# Altium schematic sheet Sheet2 (1).SchDoc
size A3; SheetNumber: 1; SheetTotal: 1
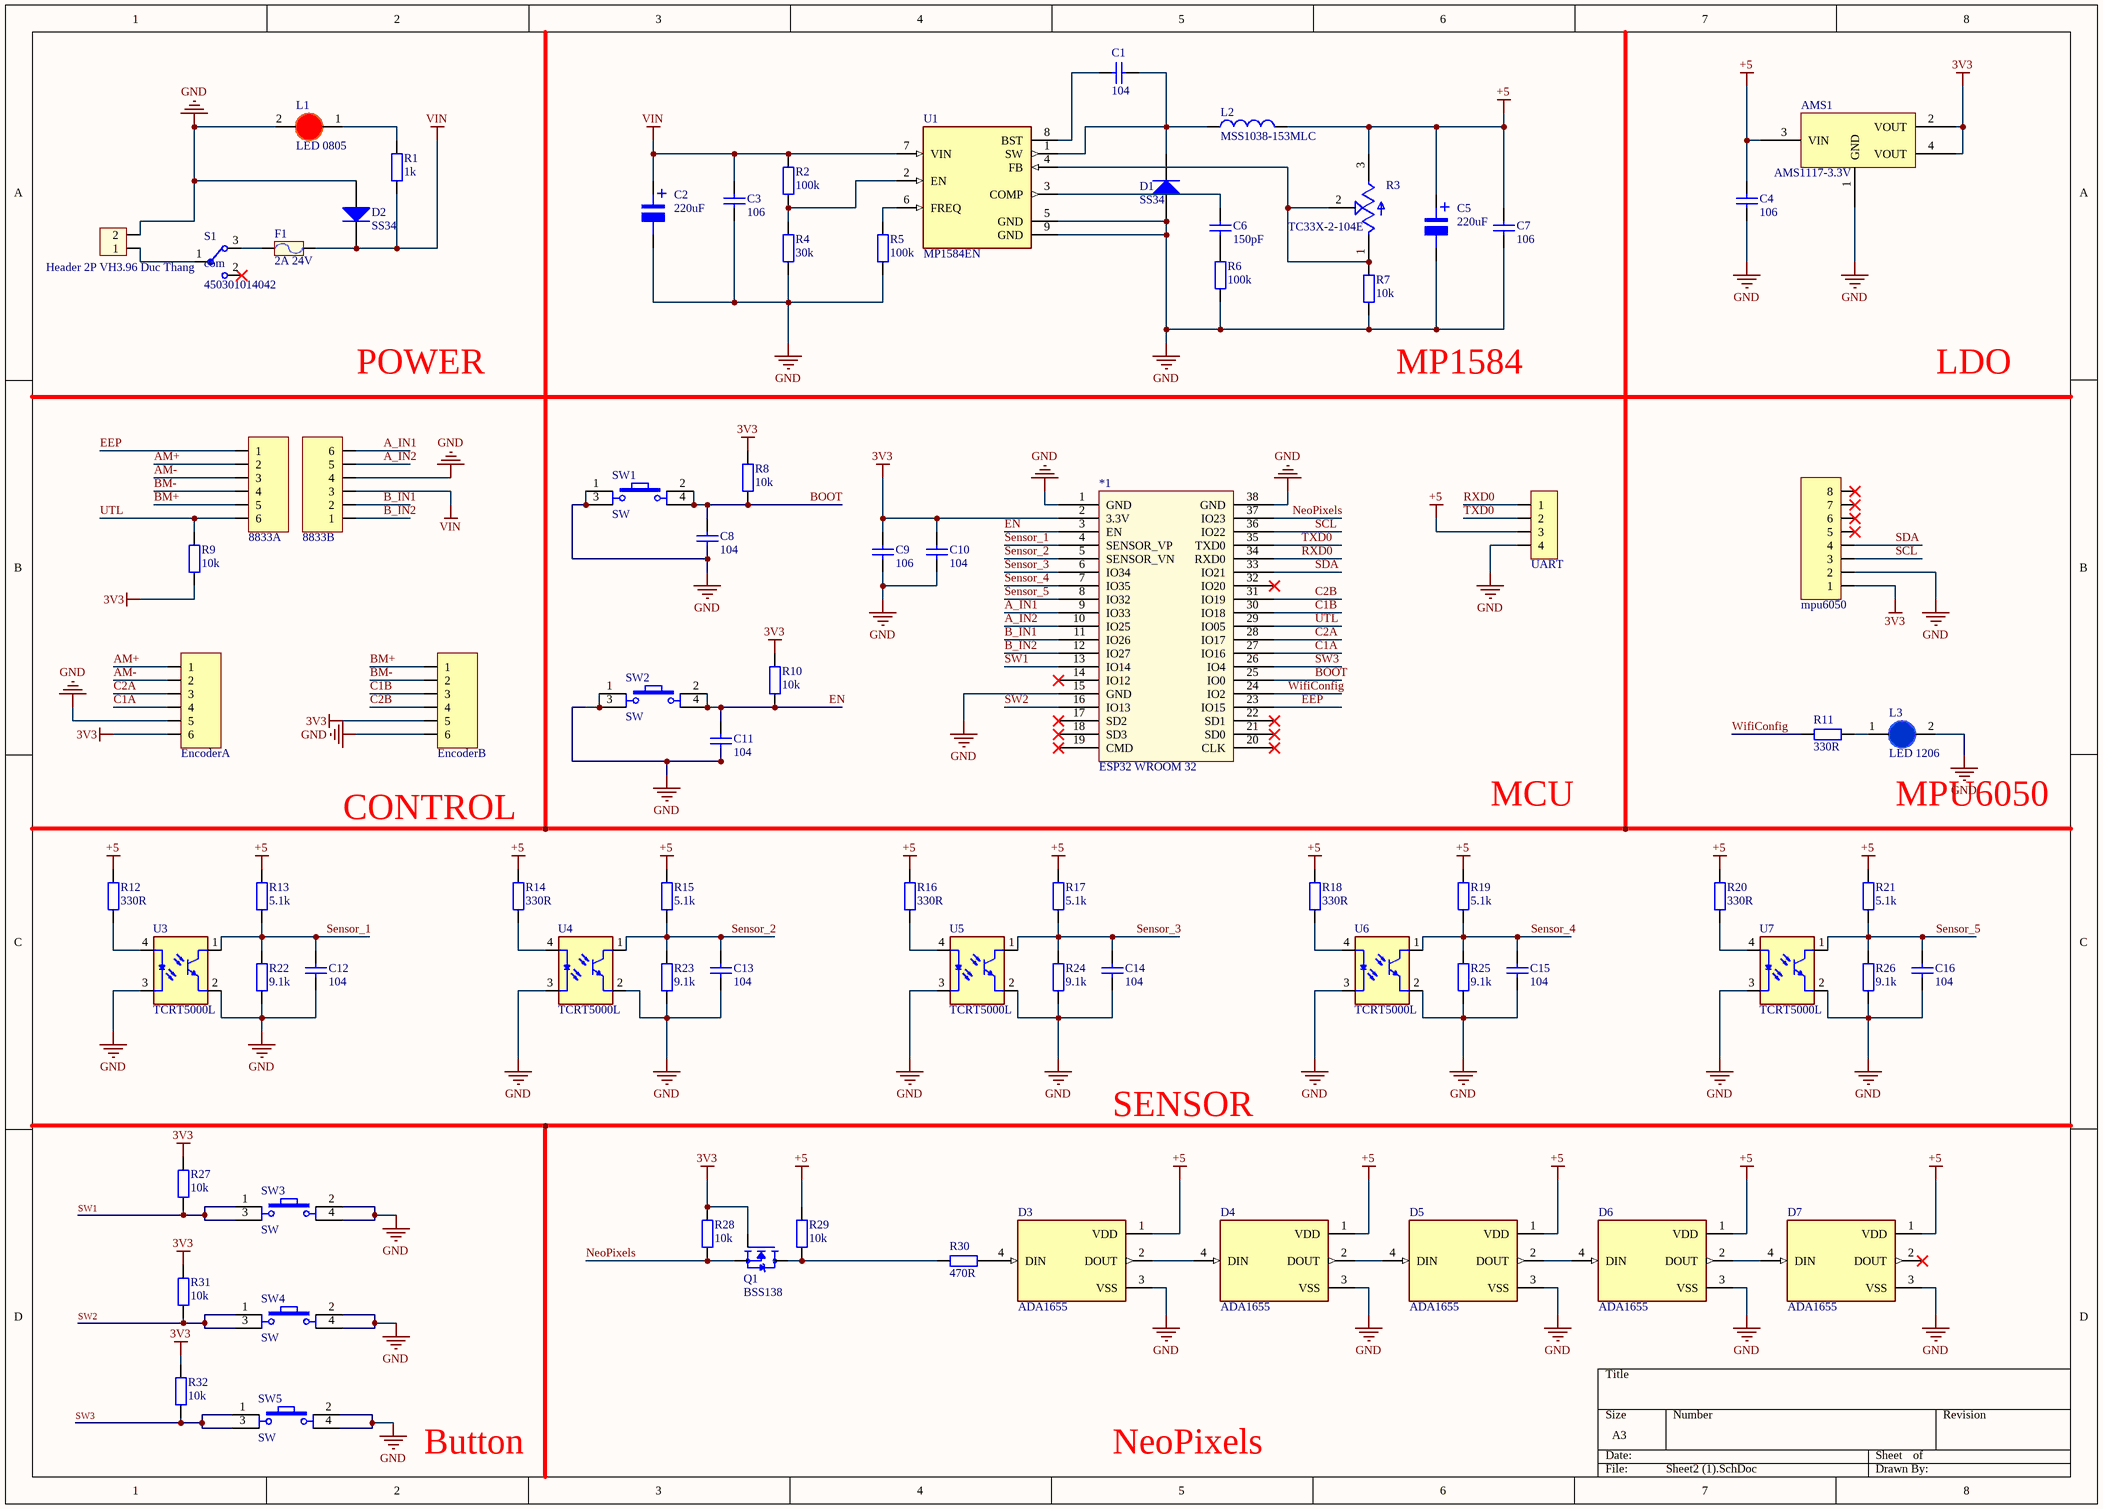
[diagram p0: Sheet2 (1).SchDoc]

## Parts
*1  ESP32 WROOM 32  [ESP32-WROOM-32D]
AMS1  AMS1117-3.3V  [SOT223]
C1  104  [tu 0603]
C2  220uF  [tu nhom 8 (f)]
C3  106  [tu 0603]
C4  106  [tu 0603]
C5  220uF  [tu nhom 8 (f)]
C6  150pF  [Cap 0603]
C7  106  [tu 0603]
C8  104  [tu 0603]
C9  106  [tu 0603]
C10  104  [tu 0603]
C11  104  [tu 0603]
C12  104  [tu 0603]
C13  104  [tu 0603]
C14  104  [tu 0603]
C15  104  [tu 0603]
C16  104  [tu 0603]
D1  SS34  [DIODE SMA]
D2  SS34  [DIODE SMA]
D3  ADA1655  [LED_ADA1655]
D4  ADA1655  [LED_ADA1655]
D5  ADA1655  [LED_ADA1655]
D6  ADA1655  [LED_ADA1655]
D7  ADA1655  [LED_ADA1655]
F1  2A 24V  [Cau chi tu phuc hoi 2A 24V SMD1812]
H?  Header 2P VH3.96 Duc Thang  [VH3.96M-2]
JP1  8833A  [JP 1x6 DT]
JP2  8833B  [JP 1x6 DT]
JP3  UART  [JP 1x4 DT]
JP4  EncoderA  [JP 1x6 DT]
JP5  EncoderB  [JP 1x6 DT]
JP?  mpu6050  [JP 1x8 DT]
L1  LED 0805  [LED-1206-Red]
L2  MSS1038-153MLC  [IND_370_401_140X70_SMD]
L3  LED 1206  [LED-1206-Blue]
Q1  BSS138  [SOT95P240X111-3N]
R1  1k  [tro smd 0805]
R2  100k  [tro smd 0603]
R3  TC33X-2-104E  [TRIM_TC33X-2-502G]
R4  30k  [RES 0603]
R5  100k  [tro smd 0603]
R6  100k  [tro smd 0603]
R7  10k  [tro smd 0603]
R8  10k  [tro smd 0603]
R9  10k  [tro smd 0603]
R10  10k  [tro smd 0603]
R11  330R  [Tro SMD 0805]
R12  330R  [tro smd 0603]
R13  5.1k  [RES 0603]
R14  330R  [tro smd 0603]
R15  5.1k  [RES 0603]
R16  330R  [tro smd 0603]
R17  5.1k  [RES 0603]
R18  330R  [tro smd 0603]
R19  5.1k  [RES 0603]
R20  330R  [tro smd 0603]
R21  5.1k  [RES 0603]
R22  9.1k  [RES 0603]
R23  9.1k  [RES 0603]
R24  9.1k  [RES 0603]
R25  9.1k  [RES 0603]
R26  9.1k  [RES 0603]
R27  10k  [tro smd 0603]
R28  10k  [tro smd 0603]
R29  10k  [tro smd 0603]
R30  470R  [RES 0603]
R31  10k  [tro smd 0603]
R32  10k  [tro smd 0603]
S1  450301014042  [450301014042]
SW1  SW  [SW4 - SMD]
SW2  SW  [SW4 - SMD]
SW3  SW  [SW4 - SMD]
SW4  SW  [SW4 - SMD]
SW5  SW  [SW4 - SMD]
U1  MP1584EN  [SOIC127P600X170-9N]
U3  TCRT5000L  [XDCR_TCRT5000L]
U4  TCRT5000L  [XDCR_TCRT5000L]
U5  TCRT5000L  [XDCR_TCRT5000L]
U6  TCRT5000L  [XDCR_TCRT5000L]
U7  TCRT5000L  [XDCR_TCRT5000L]

## Nets
3V3: *1.2(3.3V) AMS1.2(VOUT) AMS1.4(VOUT) C9.1 C10.1 JP4.6 JP5.5 JP?.1 Q1.1(G) R8.2 R9.1 R10.2 R27.2 R28.2 R31.2 R32.2
+5: AMS1.3(VIN) C4.1 C5.1 C7.1 D3.1(VDD) D4.1(VDD) D5.1(VDD) D6.1(VDD) D7.1(VDD) JP3.3 L2.2 R3.3(CW) R12.2 R13.2 R14.2 R15.2 R16.2 R17.2 R18.2 R19.2 R20.2 R21.2 R29.2
GND: *1.1(GND) *1.15(GND) *1.38(GND) AMS1.1(GND) C2.2 C3.2 C4.2 C5.2 C7.2 C8.2 C9.2 C10.2 C11.2 C12.2 C13.2 C14.2 C15.2 C16.2 D1.1(A) D2.1(A) D3.3(VSS) D4.3(VSS) D5.3(VSS) D6.3(VSS) D7.3(VSS) H?.2 JP2.4 JP3.4 JP4.5 JP5.6 JP?.2 L1.2(K) L3.2(K) R4.1 R5.2 R6.2 R7.1 R22.1 R23.1 R24.1 R25.1 R26.1 SW1.1 SW1.3 SW2.1 SW2.3 SW3.2 SW3.4 SW4.2 SW4.4 SW5.2 SW5.4 U1.5(GND) U1.9(GND) U3.2(E) U3.3(C) U4.2(E) U4.3(C) U5.2(E) U5.3(C) U6.2(E) U6.3(C) U7.2(E) U7.3(C)
VIN: C2.1 C3.1 D2.2(K) F1.2 JP2.3 R1.1 R2.1 U1.7(VIN)
A_IN1: *1.9(IO33) JP2.6
A_IN2: *1.10(IO25) JP2.5
AM+: JP1.2 JP4.1
AM-: JP1.3 JP4.2
B_IN1: *1.11(IO26) JP2.2
B_IN2: *1.12(IO27) JP2.1
BM+: JP1.5 JP5.1
BM-: JP1.4 JP5.2
BOOT: *1.25(IO0) C8.1 R8.1 SW1.2 SW1.4
C1A: *1.27(IO16) JP4.4
C1B: *1.30(IO18) JP5.3
C2A: *1.28(IO17) JP4.3
C2B: *1.31(IO19) JP5.4
EEP: *1.23(IO15) JP1.1
EN: *1.3(EN) C11.1 R10.1 SW2.2 SW2.4
NeoPixels: *1.37(IO23) Q1.2(S) R28.1
RXD0: *1.34(RXD0) JP3.1
SCL: *1.36(IO22) JP?.3
SDA: *1.33(IO21) JP?.4
Sensor_1: *1.4(SENSOR_VP) C12.1 R13.1 R22.2 U3.1(CO)
Sensor_2: *1.5(SENSOR_VN) C13.1 R15.1 R23.2 U4.1(CO)
Sensor_3: *1.6(IO34) C14.1 R17.1 R24.2 U5.1(CO)
Sensor_4: *1.7(IO35) C15.1 R19.1 R25.2 U6.1(CO)
Sensor_5: *1.8(IO32) C16.1 R21.1 R26.2 U7.1(CO)
SW1: *1.13(IO14) R27.1 SW3.1 SW3.3
SW2: *1.16(IO13) R31.1 SW4.1 SW4.3
SW3: *1.26(IO4) R32.1 SW5.1 SW5.3
TXD0: *1.35(TXD0) JP3.2
UTL: *1.29(IO05) JP1.6 R9.2
WifiConfig: *1.24(IO2) R11.1
NetC1_1: C1.1 U1.8(BST)
NetC1_2: C1.2 D1.2(K) L2.1 U1.1(SW)
NetC6_1: C6.1 U1.3(COMP)
NetC6_2: C6.2 R6.1
NetD3_2: D3.2(DOUT) D4.4(DIN)
NetD3_4: D3.4(DIN) R30.2
NetD4_2: D4.2(DOUT) D5.4(DIN)
NetD5_2: D5.2(DOUT) D6.4(DIN)
NetD6_2: D6.2(DOUT) D7.4(DIN)
NetF1_1: F1.1 S1.3
NetH?_1: H?.1 S1.1
NetL1_1: L1.1(A) R1.2
NetL3_1: L3.1(A) R11.2
NetQ1_3: Q1.3(D) R29.1 R30.1
NetR2_2: R2.2 R4.2 U1.2(EN)
NetR3_1: R3.1(CCW) R3.2(W) R7.2 U1.4(FB)
NetR5_1: R5.1 U1.6(FREQ)
NetR12_1: R12.1 U3.4(A)
NetR14_1: R14.1 U4.4(A)
NetR16_1: R16.1 U5.4(A)
NetR18_1: R18.1 U6.4(A)
NetR20_1: R20.1 U7.4(A)

Not connected (* = marked no-connect by the designer): *1 14(IO12)* 17(SD2)* 18(SD3)* 19(CMD)* 20(CLK)* 21(SD0)* 22(SD1)* 32(IO20)*; D7 2(DOUT)*; JP? 5* 6* 7* 8*; S1 2*

## Notes on the sheet
- POWER
- (near R7) MP1584
- LDO
- CONTROL
- MCU
- (near L3) MPU6050
- SENSOR
- Button
- NeoPixels
- (in symbol 450301014042) com
- (in symbol Tu Nhom 220uF 25V) +

## Library data of the parts
AMS1 = AMS1117 SMD: Dán; Value: AMS1117-3.3V SOT223; Don_Vi: Con; Ma_Hang: MH000596; Ghi_Chu: *; Kieu_Chan: *; Chung_Loai: Dán
C1 C8 C10-C16 = Tu 0603 104 50V 10%: Dán; Don_Vi: Con; So_Chan: 2; Ten_Linh_Kien: Tụ 0603 104-100nF 10% 50V; Ma_Hang: MH004568; Chung_Loai: Dán; Kieu_Chan: *
C2 C5 = Tu Nhom 220uF 25V: Dán; Don_Vi: Con; So_Chan: 2; Ten_Linh_Kien: Tụ Nhôm 220uF 25V; Ma_Hang: MH002221; Chung_Loai: Dán; Kieu_Chan: *
C3 C4 C7 C9 = Tu 0603 106 16V 20%: Dán; Don_Vi: Con; So_Chan: 2; Ten_Linh_Kien: Tụ 0603-10uF 20% 16V; Ma_Hang: MH004848; Chung_Loai: Dán; Kieu_Chan: *
C6 = Tu 0805 15pF 50V 10%: Dán; Don_Vi: Con; So_Chan: 2; Ten_Linh_Kien: Tụ 0805 15P 10% 50V; Ma_Hang: MH004556; Chung_Loai: Dán; Kieu_Chan: *
D1 D2 = Diode SS34 ( 1N5822 ): Dán; Don_Vi: Con; Ma_Hang: MH002104; Ten_Linh_Kien: Diode SS34 3A 40V SMA ( 1N5822 SS34A); Kieu_Chan: *; Chung_Loai: Dán
D3-D7 = ADA1655: WS2812B 5050 RGB LED with Integrated Driver Chip - 10 Pack; MF: Adafruit Industries; Package: 5050 Worldsemi; Check_prices: https://www.snapeda.com/parts/ADA1655/Adafruit%20Industries/view-part/48810/?ref=eda; Value: *; Price: None; MP: ADA1655; SnapEDA_Link: https://www.snapeda.com/parts/ADA1655/Adafruit%20Industries/view-part/48810/?ref=snap; Availability: No availability data
F1 = Cau chi tu phuc hoi 2A 24V SMD1812: 2A 24V SMD1812; Ma_Hang: MH010033; Ten: Cầu Chì Tự Phục Hồi 2A 24V SMD1812
H? = Header 2P VH3.96 Duc Thang: Cắm; Ten_Linh_Kien: Header 2P XH2.54-2P Đực Thẳng; Don_Vi: Con; Ma_Hang: MH001283; Chung_Loai: Cắm
JP1 JP2 JP4 JP5 = JP 1x6 2.54 Duc Thang: Cắm; Ten_Linh_Kien: Jump Đơn Đực 2.54MM 1x40P Thẳng 11MM; Don_Vi: Con; Ma_Hang: MH000903; Ghi_Chu: *; Kieu_Chan: *; Chung_Loai: Cắm
JP3 = JP 1x4 2.54 Duc Thang: Cắm; Ten_Linh_Kien: Jump Đơn Đực 2.54MM 1x40P Thẳng 11MM; Don_Vi: Con; Ma_Hang: MH000903; Ghi_Chu: *; Kieu_Chan: *; Chung_Loai: Cắm
JP? = JP 1x8 2.54 Duc Thang: Cắm; Ten_Linh_Kien: Jump Đơn Đực 2.54MM 1x40P Thẳng 11MM; Don_Vi: Con; Ma_Hang: MH000903; Ghi_Chu: *; Kieu_Chan: *; Chung_Loai: Cắm
L1 = LED 1206 Do: Dán; Don_Vi: Con; Ma_Hang: MH002334; Ten_Linh_Kien: LED1206 Màu Đỏ (Red); Ghi_Chu: *; Kieu_Chan: *; Chung_Loai: Dán
L2 = IND_15uH-3.8A-30%-SMD: Fixed Inductors MSS1038 SMT Shielded 15 uH 20 % 3.8 A; Manufacturer: Bourns; Alternate Part Number-1: NA; Manufacturer Part Number: MSS1038-153MLC; Case/Package: SMD; Supplier-1: COILCRAFT SAMPLE; Supplier Part Number-1: MSS1038-153MLC
L3 = LED 1206 Xanh Duong: Dán; Don_Vi: Con; Ma_Hang: MH002333; Ten_Linh_Kien: LED1206 Màu Xanh Dương (Blue); Ghi_Chu: *; Kieu_Chan: *; Chung_Loai: Dán
Q1 = BSS138: N-Channel 50 V 220mA (Ta) 350mW (Ta) Surface Mount SOT-23-3; MF: onsemi; SnapEDA_Link: https://www.snapeda.com/parts/BSS138/Onsemi/view-part/?ref=snap; Package: SOT-23-3 ON Semiconductor; Value: *; MP: BSS138; Check_prices: https://www.snapeda.com/parts/BSS138/Onsemi/view-part/?ref=eda
R1 = Tro 0805 1% 1k: Dán; Don_Vi: Con; So_Chan: 2; Ten_Linh_Kien: Trở 0805 1% 1k; Ma_Hang: MH005468; Chung_Loai: Dán; Kieu_Chan: *
R2 R5 R6 = Tro 0603 5% 100k: Dán; So_Chan: 2; Ten_Linh_Kien: Trở 0603 5% 100k; Ma_Hang: MH006314; Don_Vi: Con; Chung_Loai: Dán; Kieu_Chan: *
R3 = TC33X-2-502G: 5 kOhms 0.1W, 1/10W J Lead Surface Mount Trimmer Potentiometer Cermet 1 Turn Top Adjustment; MF: Bourns; Digi-Key_Part_Number: TC33X-2-502GCT-ND; Package: SOD-23 Bourns; Value: *; Check_prices: https://www.snapeda.com/parts/TC33X-2-502G/Bourns/view-part/1439711/?ref=eda; SnapEDA_Link: https://www.snapeda.com/parts/TC33X-2-502G/Bourns/view-part/1439711/?ref=snap; Purchase-URL: https://pricing.snapeda.com/search/part/TC33X-2-502G/?ref=eda; MP: TC33X-2-502G
R4 = Tro 0805 5% 30k: Dán; Don_Vi: Con; So_Chan: 2; Ten_Linh_Kien: Trở 0805 5% 30k; Ma_Hang: MH005314; Chung_Loai: Dán; Kieu_Chan: *
R7-R10 R27-R29 R31 R32 = Tro 0603 5% 10k: Dán; Don_Vi: Con; So_Chan: 2; Ten_Linh_Kien: Trở 0603 5% 10k; Ma_Hang: MH006316; Chung_Loai: Dán; Kieu_Chan: *
R11 = Tro 0805 5% 330R: Dán; Don_Vi: Con; So_Chan: 2; Ten_Linh_Kien: Trở 0805 5% 330R; Ma_Hang: MH005337; Chung_Loai: Dán; Kieu_Chan: *
R12 R14 R16 R18 R20 = Tro 0603 5% 330R: Dán; Don_Vi: Con; Ma_Hang: MH006910; So_Chan: 2; Ten_Linh_Kien: Trở 0603 5% 330R; Chung_Loai: Dán; Kieu_Chan: *
R13 R15 R17 R19 R21 = Tro 0805 1% 5.1k: Dán; Don_Vi: Con; So_Chan: 2; Ten_Linh_Kien: Trở 0805 1% 5.1k; Ma_Hang: MH008812; Chung_Loai: Dán; Kieu_Chan: *
R22-R26 = Tro 0805 1% 9.1k: Dán; Don_Vi: Con; So_Chan: 2; Ten_Linh_Kien: Trở 0805 1% 9.1k; Ma_Hang: MH008813; Chung_Loai: Dán; Kieu_Chan: *
R30 = Tro 0805 5% 470R: Dán; Don_Vi: Con; Ma_Hang: MH005341; Ten_Linh_Kien: Trở 0805 5% 470R; So_Chan: 2; Chung_Loai: Dán; Kieu_Chan: *
S1 = 450301014042: MF: {'manufacturer': u'W\xfcrth Elektronik'}; Package: None; Price: None; Value: *; MP: 450301014042; Availability: Unavailable
SW1-SW5 = SW4: Switch button 4 pin; Value: Button chip 4 pin
U1 = MP1584EN: Buck Switching Regulator IC Positive Adjustable 0.8V 1 Output 3A 8-SOIC (0.154, 3.90mm Width) Exposed Pad; MF: Monolithic Power; Value: *; SnapEDA_Link: https://www.snapeda.com/parts/MP1584EN/Monolithic+Power+Systems+Inc./view-part/?ref=snap; MP: MP1584EN; Purchase-URL: https://pricing.snapeda.com/search/part/MP1584EN/?ref=eda; Check_prices: https://www.snapeda.com/parts/MP1584EN/Monolithic+Power+Systems+Inc./view-part/?ref=eda; Availability: In Stock; Price: None; Package: SOIC-8 Monolithic Power
U3-U7 = TCRT5000L: Reflective Optical Sensor 0.591 (15mm) PCB Mount; MF: Vishay Semiconductor; SnapEDA_Link: https://www.snapeda.com/parts/TCRT5000L/Vishay/view-part/?ref=snap; Package: None; Value: *; MP: TCRT5000L; Check_prices: https://www.snapeda.com/parts/TCRT5000L/Vishay/view-part/?ref=eda